# EasyEDA schematic Wireless_EV_Charging_EasyEDA_Std_source.json
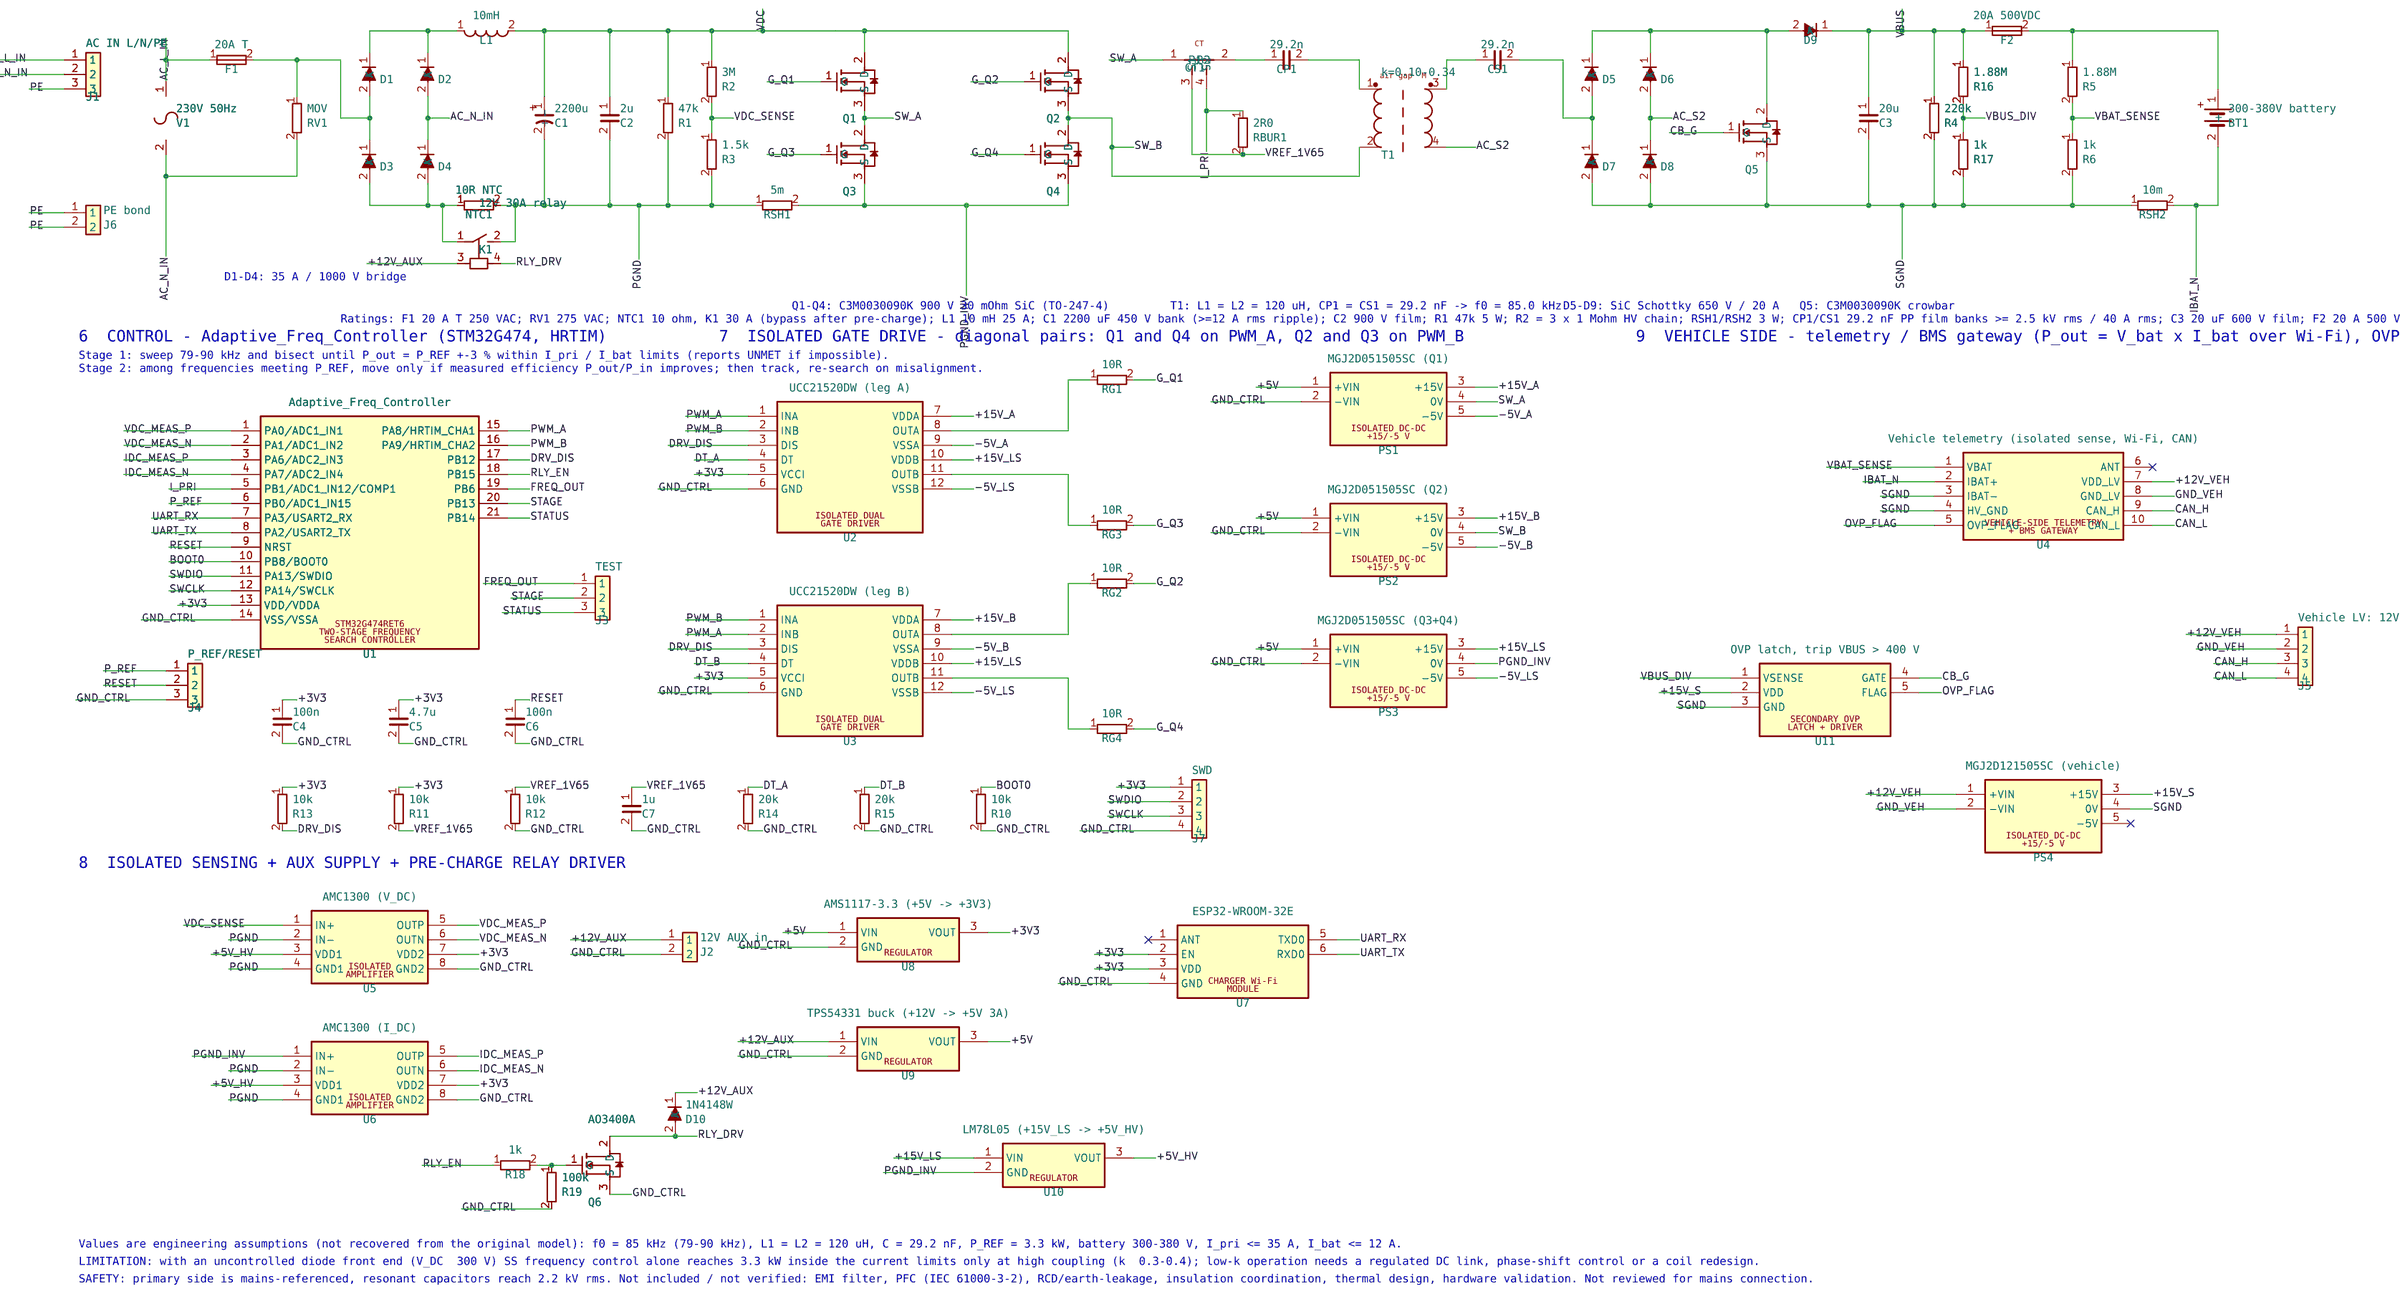
[diagram p0: schematic sheet]

## Parts
BT1  300-380V battery
C1  2200u
C2  2u
C3  20u
C4  100n
C5  4.7u
C6  100n
C7  1u
CP1  29.2n
CS1  29.2n
CT1  CT
D1  D_V
D2  D_V
D3  D_V
D4  D_V
D5  D_V
D6  D_V
D7  D_V
D8  D_V
D9  D_H
D10  1N4148W
F1  20A T
F2  20A 500VDC
J1  AC IN L/N/PE
J2  12V AUX in
J3  TEST
J4  P_REF/RESET
J5  Vehicle LV: 12V/GND/CAN
J6  PE bond
J7  SWD
K1  12V 30A relay
L1  10mH
NTC1  10R NTC
PS1  MGJ2D051505SC (Q1)
PS2  MGJ2D051505SC (Q2)
PS3  MGJ2D051505SC (Q3+Q4)
PS4  MGJ2D121505SC (vehicle)
Q1  NMOS
Q2  NMOS
Q3  NMOS
Q4  NMOS
Q5  NMOS
Q6  AO3400A
R1  47k
R2  3M
R3  1.5k
R4  220k
R5  1.88M
R6  1k
R10  10k
R11  10k
R12  10k
R13  10k
R14  20k
R15  20k
R16  1.88M
R17  1k
R18  1k
R19  100k
RBUR1  2R0
RG1  10R
RG2  10R
RG3  10R
RG4  10R
RSH1  5m
RSH2  10m
RV1  MOV
T1  k=0.10-0.34
U1  Adaptive_Freq_Controller
U2  UCC21520DW (leg A)
U3  UCC21520DW (leg B)
U4  Vehicle telemetry (isolated sense, Wi-Fi, CAN)
U5  AMC1300 (V_DC)
U6  AMC1300 (I_DC)
U7  ESP32-WROOM-32E
U8  AMS1117-3.3 (+5V -> +3V3)
U9  TPS54331 buck (+12V -> +5V 3A)
U10  LM78L05 (+15V_LS -> +5V_HV)
U11  OVP latch, trip VBUS > 400 V
V1  230V 50Hz

## Nets
+3V3: C4.1 C5.1 J7.1 R11.1 R13.1 U1.13(VDD/VDDA) U2.5(VCCI) U3.5(VCCI) U5.7(VDD2) U6.7(VDD2) U7.2(EN) U7.3(VDD) U8.3(VOUT)
+5V: PS1.1(+VIN) PS2.1(+VIN) PS3.1(+VIN) U8.1(VIN) U9.3(VOUT)
+5V_HV: U5.3(VDD1) U6.3(VDD1) U10.3(VOUT)
+12V_AUX: D10.1(K) J2.1 K1.3 U9.1(VIN)
+12V_VEH: J5.1 PS4.1(+VIN) U4.7(VDD_LV)
+15V_A: PS1.3(+15V) U2.7(VDDA)
+15V_B: PS2.3(+15V) U3.7(VDDA)
+15V_LS: PS3.3(+15V) U2.10(VDDB) U3.10(VDDB) U10.1(VIN)
+15V_S: PS4.3(+15V) U11.2(VDD)
-5V_A: PS1.5(-5V) U2.9(VSSA)
-5V_B: PS2.5(-5V) U3.9(VSSA)
-5V_LS: PS3.5(-5V) U2.12(VSSB) U3.12(VSSB)
GND_CTRL: C4.2 C5.2 C6.2 C7.2 J2.2 J4.3 J7.4 PS1.2(-VIN) PS2.2(-VIN) PS3.2(-VIN) Q6.3(S) R10.2 R12.2 R14.2 R15.2 R19.2 U1.14(VSS/VSSA) U2.6(GND) U3.6(GND) U5.8(GND2) U6.8(GND2) U7.4(GND) U8.2(GND) U9.2(GND)
GND_VEH: J5.2 PS4.2(-VIN) U4.8(GND_LV)
PGND: C1.2(-) C2.2 K1.2 NTC1.2 R1.2 R3.2 RSH1.1 U5.2(IN-) U5.4(GND1) U6.2(IN-) U6.4(GND1)
PGND_INV: PS3.4(0V) Q3.3(S) Q4.3(S) RSH1.2 U6.1(IN+) U10.2(GND)
SGND: C3.2 D7.2(A) D8.2(A) PS4.4(0V) Q5.3(S) R4.2 R6.2 R17.2 RSH2.1 U4.3(IBAT-) U4.4(HV_GND) U11.3(GND)
VBAT_SENSE: R5.2 R6.1 U4.1(VBAT)
VBUS: C3.1 D9.1(K) F2.1 R4.1 R16.1
VBUS_DIV: R16.2 R17.1 U11.1(VSENSE)
AC_L_IN: F1.1 J1.1 V1.1
AC_N_IN: D2.2(A) D4.1(K) J1.2 RV1.2 V1.2
AC_S2: D6.2(A) D8.1(K) T1.4
BOOT0: R10.1 U1.10(PB8/BOOT0)
CAN_H: J5.3 U4.9(CAN_H)
CAN_L: J5.4 U4.10(CAN_L)
CB_G: Q5.1(G) U11.4(GATE)
DRV_DIS: R13.2 U1.17(PB12) U2.3(DIS) U3.3(DIS)
DT_A: R14.1 U2.4(DT)
DT_B: R15.1 U3.4(DT)
FREQ_OUT: J3.1 U1.19(PB6)
G_Q1: Q1.1(G) RG1.2
G_Q2: Q2.1(G) RG2.2
G_Q3: Q3.1(G) RG3.2
G_Q4: Q4.1(G) RG4.2
I_PRI: CT1.4(S2) RBUR1.1 U1.5(PB1/ADC1_IN12/COMP1)
IBAT_N: BT1.2(-) RSH2.2 U4.2(IBAT+)
IDC_MEAS_N: U1.4(PA7/ADC2_IN4) U6.6(OUTN)
IDC_MEAS_P: U1.3(PA6/ADC2_IN3) U6.5(OUTP)
OVP_FLAG: U4.5(OVP_FLAG) U11.5(FLAG)
P_REF: J4.1 U1.6(PB0/ADC1_IN15)
PE: J1.3 J6.1 J6.2
PWM_A: U1.15(PA8/HRTIM_CHA1) U2.1(INA) U3.2(INB)
PWM_B: U1.16(PA9/HRTIM_CHA2) U2.2(INB) U3.1(INA)
RESET: C6.1 J4.2 U1.9(NRST)
RLY_DRV: D10.2(A) K1.4 Q6.2(D)
RLY_EN: R18.1 U1.18(PB15)
STAGE: J3.2 U1.20(PB13)
STATUS: J3.3 U1.21(PB14)
SW_A: CT1.1(P1) PS1.4(0V) Q1.3(S) Q3.2(D)
SW_B: PS2.4(0V) Q2.3(S) Q4.2(D) T1.2
SWCLK: J7.3 U1.12(PA14/SWCLK)
SWDIO: J7.2 U1.11(PA13/SWDIO)
UART_RX: U1.7(PA3/USART2_RX) U7.5(TXD0)
UART_TX: U1.8(PA2/USART2_TX) U7.6(RXD0)
VDC: C1.1(+) C2.1 L1.2 Q1.2(D) Q2.2(D) R1.1 R2.1
VDC_MEAS_N: U1.2(PA1/ADC1_IN2) U5.6(OUTN)
VDC_MEAS_P: U1.1(PA0/ADC1_IN1) U5.5(OUTP)
VDC_SENSE: R2.2 R3.1 U5.1(IN+)
VREF_1V65: C7.1 CT1.3(S1) R11.2 R12.1 RBUR1.2
Net-(BT1-1): BT1.1(+) F2.2 R5.1
Net-(CP1-1): CP1.1 CT1.2(P2)
Net-(CP1-2): CP1.2 T1.1
Net-(CS1-1): CS1.1 T1.3
Net-(CS1-2): CS1.2 D5.2(A) D7.1(K)
Net-(D1-1): D1.1(K) D2.1(K) L1.1
Net-(D1-2): D1.2(A) D3.1(K) F1.2 RV1.1
Net-(D3-2): D3.2(A) D4.2(A) K1.1 NTC1.1
Net-(D5-1): D5.1(K) D6.1(K) D9.2(A) Q5.2(D)
Net-(Q6-1): Q6.1(G) R18.2 R19.1
Net-(RG1-1): RG1.1 U2.8(OUTA)
Net-(RG2-1): RG2.1 U3.8(OUTA)
Net-(RG3-1): RG3.1 U2.11(OUTB)
Net-(RG4-1): RG4.1 U3.11(OUTB)

Not connected (* = marked no-connect by the designer): PS4 5(-5V)*; U4 6(ANT)*; U7 1(ANT)*

## Notes on the sheet
- WIRELESS EV CHARGER - SS-COMPENSATED 85 kHz WPT WITH TWO-STAGE AUTOMATIC FREQUENCY SEARCH
- Power topology follows the Simulink reference (230 V AC, diode bridge, L-C DC link, 4-MOSFET full bridge, series C + coupled TX/RX coils + series C, diode bridge, C + R, battery).
- 1  AC INPUT
- 2  RECTIFIER + PRE-CHARGE + L-C DC LINK
- 3  FULL-BRIDGE INVERTER
- 4  SERIES-SERIES RESONANT LINK
- 5  SECONDARY RECTIFIER + OVP CROWBAR + BATTERY (VEHICLE)
- D1-D4: 35 A / 1000 V bridge
- Q1-Q4: C3M0030090K 900 V 30 mOhm SiC (TO-247-4)
- T1: L1 = L2 = 120 uH, CP1 = CS1 = 29.2 nF -> f0 = 85.0 kHz
- D5-D9: SiC Schottky 650 V / 20 A   Q5: C3M0030090K crowbar
- Ratings: F1 20 A T 250 VAC; RV1 275 VAC; NTC1 10 ohm, K1 30 A (bypass after pre-charge); L1 10 mH 25 A; C1 2200 uF 450 V bank (>=12 A rms ripple); C2 900 V film; R1 47k 5 W; R2 = 3 x 1 Mohm HV chain; RSH1/RSH2 3 W; CP1/CS1 29.2 nF PP film banks >= 2.5 kV rms / 40 A rms; C3 20 uF 600 V film; F2 20 A 500 VDC; RBUR 0.5 W; CT1 1:100.
- 6  CONTROL - Adaptive_Freq_Controller (STM32G474, HRTIM)
- 7  ISOLATED GATE DRIVE - diagonal pairs: Q1 and Q4 on PWM_A, Q2 and Q3 on PWM_B
- 9  VEHICLE SIDE - telemetry / BMS gateway (P_out = V_bat x I_bat over Wi-Fi), OVP crowbar
- Stage 1: sweep 79-90 kHz and bisect until P_out = P_REF +-3 % within I_pri / I_bat limits (reports UNMET if impossible).
- Stage 2: among frequencies meeting P_REF, move only if measured efficiency P_out/P_in improves; then track, re-search on misalignment.
- 8  ISOLATED SENSING + AUX SUPPLY + PRE-CHARGE RELAY DRIVER
- Values are engineering assumptions (not recovered from the original model): f0 = 85 kHz (79-90 kHz), L1 = L2 = 120 uH, C = 29.2 nF, P_REF = 3.3 kW, battery 300-380 V, I_pri <= 35 A, I_bat <= 12 A.
- LIMITATION: with an uncontrolled diode front end (V_DC  300 V) SS frequency control alone reaches 3.3 kW inside the current limits only at high coupling (k  0.3-0.4); low-k operation needs a regulated DC link, phase-shift control or a coil redesign.
- SAFETY: primary side is mains-referenced, resonant capacitors reach 2.2 kV rms. Not included / not verified: EMI filter, PFC (IEC 61000-3-2), RCD/earth-leakage, insulation coordination, thermal design, hardware validation. Not reviewed for mains connection.
- Protection: primary OCP = I_PRI -> STM32 COMP1 -> HRTIM fault (firmware); secondary OVP = U11 latch fires Q5 crowbar (SS: secondary short collapses primary current) + OVP_FLAG; F2 fuse; charging CC/CV only via P_REF from vehicle BMS (CAN -> Wi-Fi).
